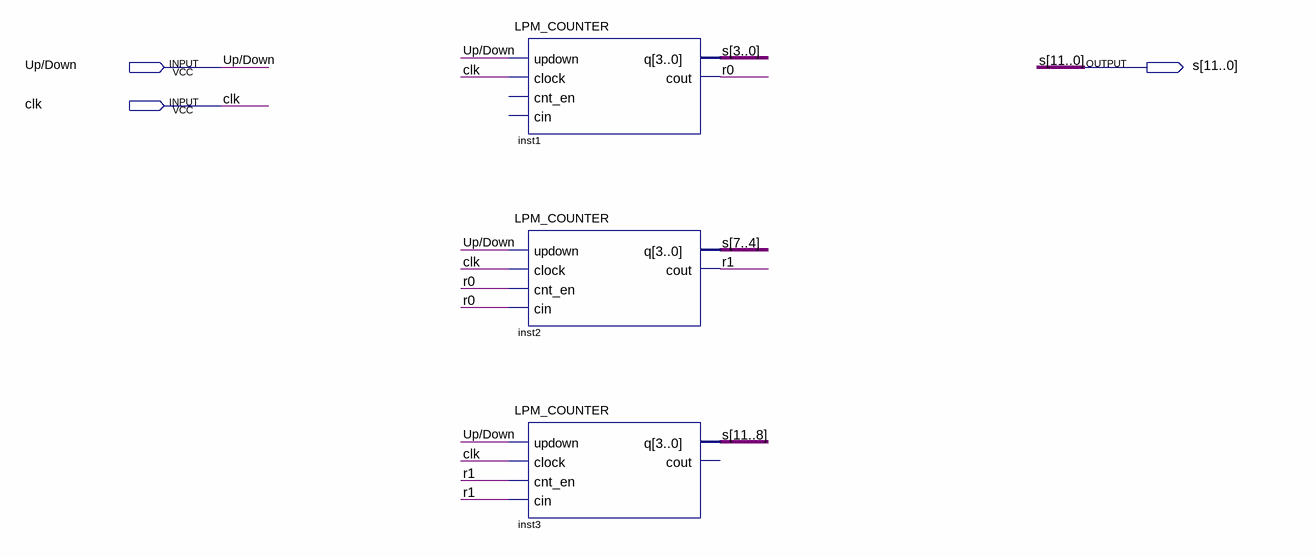
[diagram p0: schematic sheet]
// Quartus schematic comptdecompt12b.bdf as structural Verilog: 3 symbols, 3 pins
module comptdecompt12b (
  input  \Up/Down ,
  input  clk,
  output [11:0] s
);

  wire r0, r1;

  LPM_COUNTER #(.LPM_WIDTH(4), .LPM_MODULUS(10), .LPM_PORT_UPDOWN("PORT_USED"), .LPM_TYPE("LPM_COUNTER")) inst1 (
    .updown(\Up/Down ), .clock(clk), .q(s[3:0]), .cout(r0));  // open: cnt_en, cin
  LPM_COUNTER #(.LPM_WIDTH(4), .LPM_MODULUS(10), .LPM_PORT_UPDOWN("PORT_USED"), .LPM_TYPE("LPM_COUNTER")) inst2 (
    .updown(\Up/Down ), .clock(clk), .cnt_en(r0), .cin(r0), .q(s[7:4]), .cout(r1));
  LPM_COUNTER #(.LPM_WIDTH(4), .LPM_MODULUS(10), .LPM_PORT_UPDOWN("PORT_USED"), .LPM_TYPE("LPM_COUNTER")) inst3 (
    .updown(\Up/Down ), .clock(clk), .cnt_en(r1), .cin(r1), .q(s[11:8]));  // open: cout
endmodule
